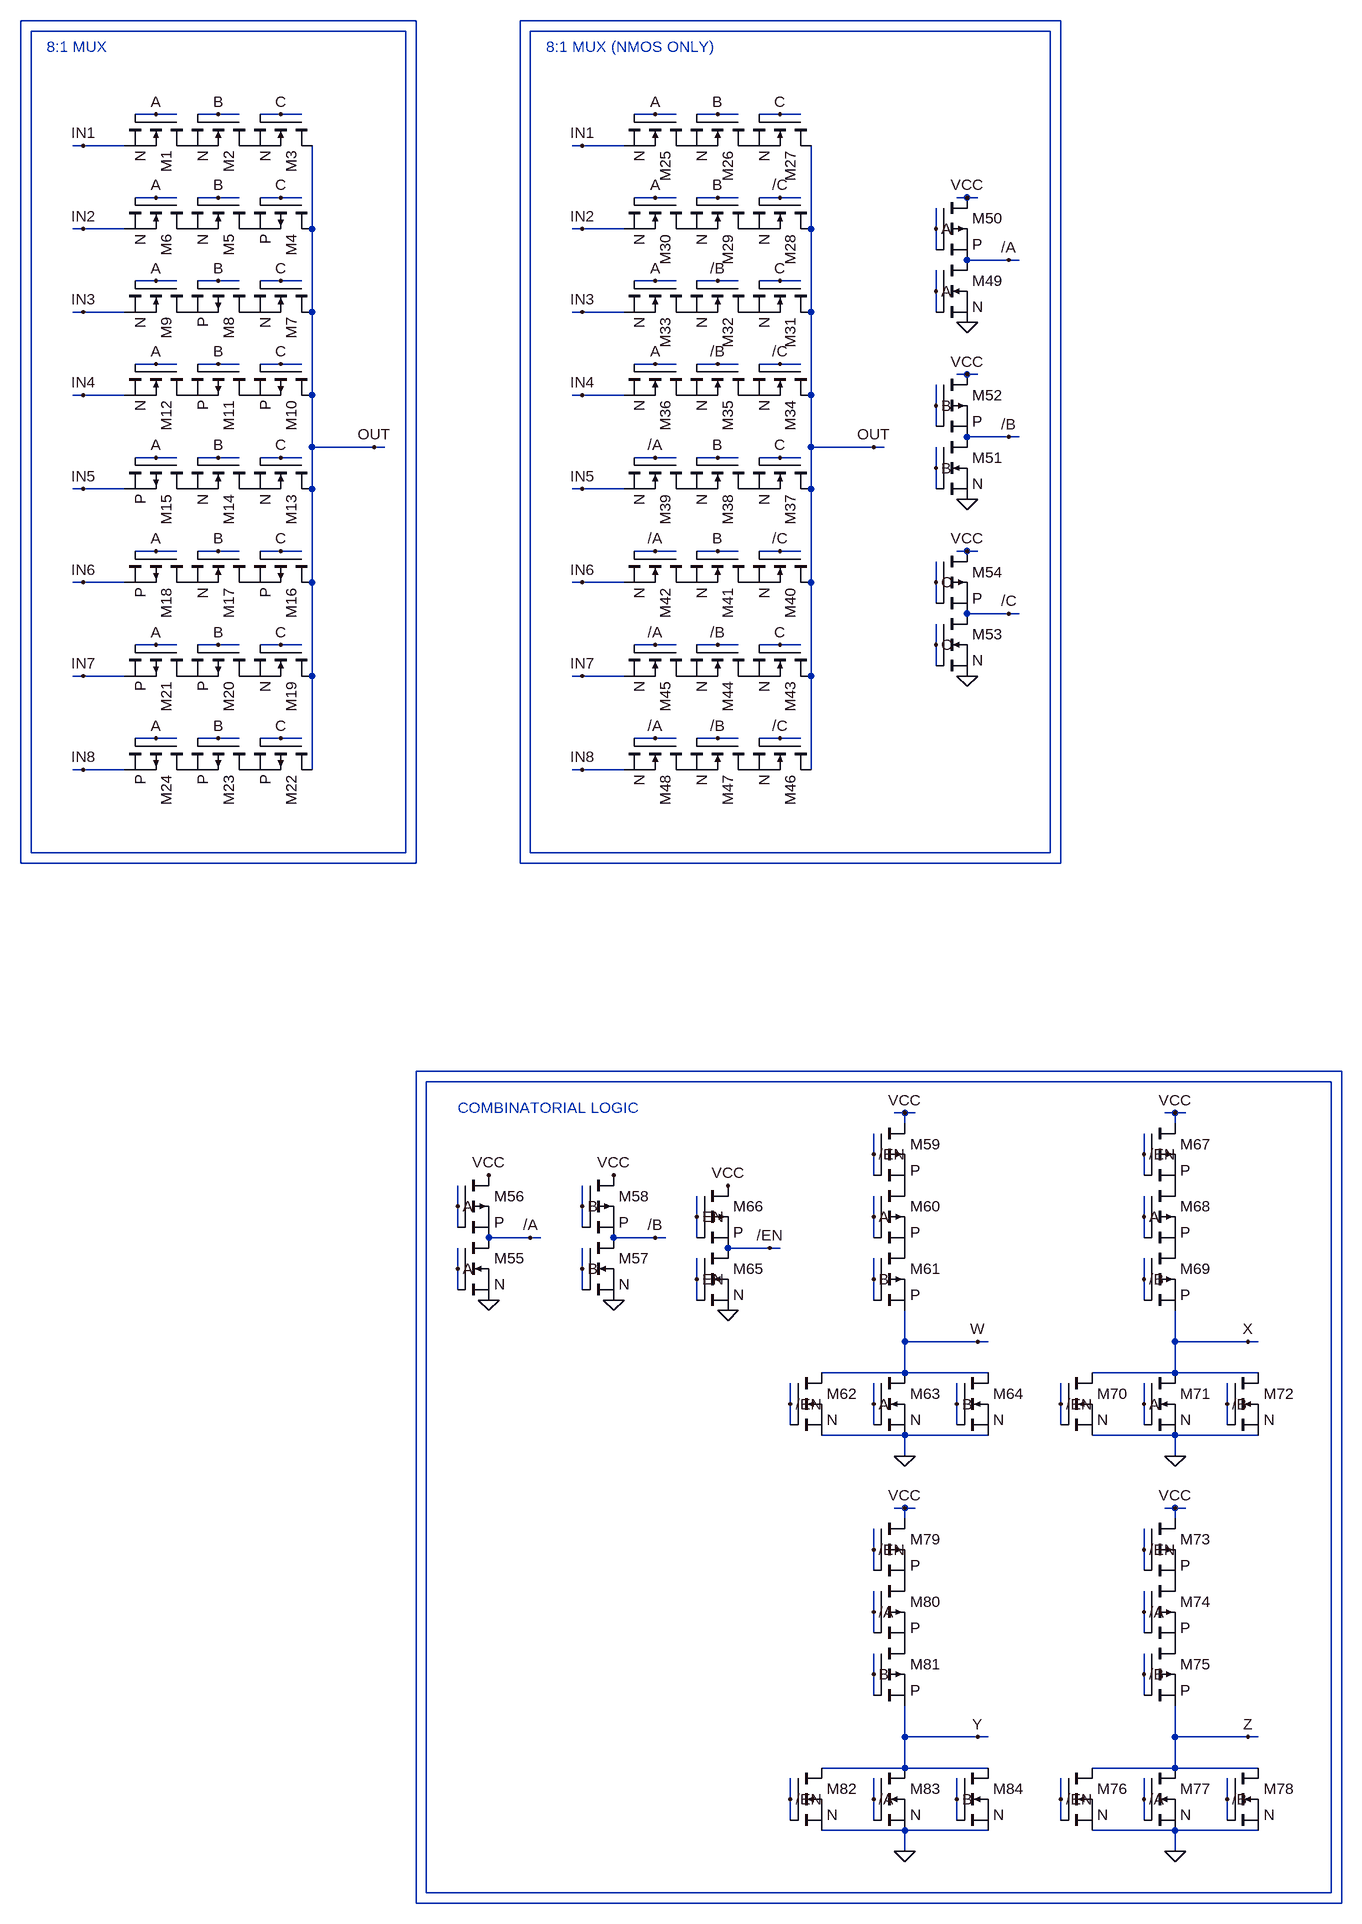
[diagram p0: schematic HW Schematics.asc]
HW Schematics.asc, the LTspice schematic file:
Version 4.1
SHEET 1 2020 2932
WIRE 592 32 -16 32
WIRE 1584 32 752 32
WIRE 576 48 0 48
WIRE 1568 48 768 48
WIRE 192 176 160 176
WIRE 224 176 192 176
WIRE 288 176 256 176
WIRE 320 176 288 176
WIRE 384 176 352 176
WIRE 416 176 384 176
WIRE 960 176 928 176
WIRE 992 176 960 176
WIRE 1056 176 1024 176
WIRE 1088 176 1056 176
WIRE 1152 176 1120 176
WIRE 1184 176 1152 176
WIRE 80 224 64 224
WIRE 144 224 80 224
WIRE 848 224 832 224
WIRE 912 224 848 224
WIRE 192 304 160 304
WIRE 224 304 192 304
WIRE 288 304 256 304
WIRE 320 304 288 304
WIRE 384 304 352 304
WIRE 416 304 384 304
WIRE 960 304 928 304
WIRE 992 304 960 304
WIRE 1056 304 1024 304
WIRE 1088 304 1056 304
WIRE 1152 304 1120 304
WIRE 1184 304 1152 304
WIRE 1440 304 1424 304
WIRE 1456 304 1440 304
WIRE 80 352 64 352
WIRE 144 352 80 352
WIRE 432 352 432 224
WIRE 848 352 832 352
WIRE 912 352 848 352
WIRE 1200 352 1200 224
WIRE 1392 352 1392 320
WIRE 1392 384 1392 352
WIRE 1504 400 1440 400
WIRE 1520 400 1504 400
WIRE 192 432 160 432
WIRE 224 432 192 432
WIRE 288 432 256 432
WIRE 320 432 288 432
WIRE 384 432 352 432
WIRE 416 432 384 432
WIRE 960 432 928 432
WIRE 992 432 960 432
WIRE 1056 432 1024 432
WIRE 1088 432 1056 432
WIRE 1152 432 1120 432
WIRE 1184 432 1152 432
WIRE 1392 448 1392 416
WIRE 80 480 64 480
WIRE 144 480 80 480
WIRE 432 480 432 352
WIRE 848 480 832 480
WIRE 912 480 848 480
WIRE 1200 480 1200 352
WIRE 1392 480 1392 448
WIRE 192 560 160 560
WIRE 224 560 192 560
WIRE 288 560 256 560
WIRE 320 560 288 560
WIRE 384 560 352 560
WIRE 416 560 384 560
WIRE 960 560 928 560
WIRE 992 560 960 560
WIRE 1056 560 1024 560
WIRE 1088 560 1056 560
WIRE 1152 560 1120 560
WIRE 1184 560 1152 560
WIRE 1440 576 1424 576
WIRE 1456 576 1440 576
WIRE 80 608 64 608
WIRE 144 608 80 608
WIRE 432 608 432 480
WIRE 848 608 832 608
WIRE 912 608 848 608
WIRE 1200 608 1200 480
WIRE 1392 624 1392 592
WIRE 1392 656 1392 624
WIRE 1504 672 1440 672
WIRE 1520 672 1504 672
WIRE 432 688 432 608
WIRE 528 688 432 688
WIRE 544 688 528 688
WIRE 1200 688 1200 608
WIRE 1296 688 1200 688
WIRE 1312 688 1296 688
WIRE 192 704 160 704
WIRE 224 704 192 704
WIRE 288 704 256 704
WIRE 320 704 288 704
WIRE 384 704 352 704
WIRE 416 704 384 704
WIRE 960 704 928 704
WIRE 992 704 960 704
WIRE 1056 704 1024 704
WIRE 1088 704 1056 704
WIRE 1152 704 1120 704
WIRE 1184 704 1152 704
WIRE 1392 720 1392 688
WIRE 80 752 64 752
WIRE 144 752 80 752
WIRE 432 752 432 688
WIRE 848 752 832 752
WIRE 912 752 848 752
WIRE 1200 752 1200 688
WIRE 1392 752 1392 720
WIRE 192 848 160 848
WIRE 224 848 192 848
WIRE 288 848 256 848
WIRE 320 848 288 848
WIRE 384 848 352 848
WIRE 416 848 384 848
WIRE 960 848 928 848
WIRE 992 848 960 848
WIRE 1056 848 1024 848
WIRE 1088 848 1056 848
WIRE 1152 848 1120 848
WIRE 1184 848 1152 848
WIRE 1440 848 1424 848
WIRE 1456 848 1440 848
WIRE 80 896 64 896
WIRE 144 896 80 896
WIRE 432 896 432 752
WIRE 848 896 832 896
WIRE 912 896 848 896
WIRE 1200 896 1200 752
WIRE 1392 896 1392 864
WIRE 1392 928 1392 896
WIRE 1504 944 1440 944
WIRE 1520 944 1504 944
WIRE 192 992 160 992
WIRE 224 992 192 992
WIRE 288 992 256 992
WIRE 320 992 288 992
WIRE 384 992 352 992
WIRE 416 992 384 992
WIRE 960 992 928 992
WIRE 992 992 960 992
WIRE 1056 992 1024 992
WIRE 1088 992 1056 992
WIRE 1152 992 1120 992
WIRE 1184 992 1152 992
WIRE 1392 992 1392 960
WIRE 1392 1024 1392 992
WIRE 80 1040 64 1040
WIRE 144 1040 80 1040
WIRE 432 1040 432 896
WIRE 848 1040 832 1040
WIRE 912 1040 848 1040
WIRE 1200 1040 1200 896
WIRE 192 1136 160 1136
WIRE 224 1136 192 1136
WIRE 288 1136 256 1136
WIRE 320 1136 288 1136
WIRE 384 1136 352 1136
WIRE 416 1136 384 1136
WIRE 960 1136 928 1136
WIRE 992 1136 960 1136
WIRE 1056 1136 1024 1136
WIRE 1088 1136 1056 1136
WIRE 1152 1136 1120 1136
WIRE 1184 1136 1152 1136
WIRE 80 1184 64 1184
WIRE 144 1184 80 1184
WIRE 432 1184 432 1040
WIRE 848 1184 832 1184
WIRE 912 1184 848 1184
WIRE 1200 1184 1200 1040
WIRE 0 1312 0 48
WIRE 576 1312 576 48
WIRE 576 1312 0 1312
WIRE 768 1312 768 48
WIRE 1568 1312 1568 48
WIRE 1568 1312 768 1312
WIRE -16 1328 -16 32
WIRE 592 1328 592 32
WIRE 592 1328 -16 1328
WIRE 752 1328 752 32
WIRE 1584 1328 1584 32
WIRE 1584 1328 752 1328
WIRE 2016 1648 592 1648
WIRE 2000 1664 608 1664
WIRE 1344 1712 1328 1712
WIRE 1360 1712 1344 1712
WIRE 1760 1712 1744 1712
WIRE 1776 1712 1760 1712
WIRE 1344 1728 1344 1712
WIRE 1760 1728 1760 1712
WIRE 1296 1776 1296 1744
WIRE 1712 1776 1712 1744
WIRE 1296 1808 1296 1776
WIRE 1712 1808 1712 1776
WIRE 656 1856 656 1824
WIRE 848 1856 848 1824
WIRE 1024 1872 1024 1840
WIRE 1296 1872 1296 1840
WIRE 1712 1872 1712 1840
WIRE 656 1888 656 1856
WIRE 848 1888 848 1856
WIRE 768 1904 704 1904
WIRE 784 1904 768 1904
WIRE 960 1904 896 1904
WIRE 976 1904 960 1904
WIRE 1024 1904 1024 1872
WIRE 1296 1904 1296 1872
WIRE 1712 1904 1712 1872
WIRE 1136 1920 1072 1920
WIRE 1152 1920 1136 1920
WIRE 656 1952 656 1920
WIRE 848 1952 848 1920
WIRE 1024 1968 1024 1936
WIRE 1296 1968 1296 1936
WIRE 1712 1968 1712 1936
WIRE 656 1984 656 1952
WIRE 848 1984 848 1952
WIRE 1024 2000 1024 1968
WIRE 1296 2000 1296 1968
WIRE 1712 2000 1712 1968
WIRE 1344 2064 1344 2016
WIRE 1456 2064 1344 2064
WIRE 1472 2064 1456 2064
WIRE 1760 2064 1760 2016
WIRE 1872 2064 1760 2064
WIRE 1888 2064 1872 2064
WIRE 1344 2112 1344 2064
WIRE 1344 2112 1216 2112
WIRE 1472 2112 1344 2112
WIRE 1760 2112 1760 2064
WIRE 1760 2112 1632 2112
WIRE 1888 2112 1760 2112
WIRE 1168 2160 1168 2128
WIRE 1296 2160 1296 2128
WIRE 1424 2160 1424 2128
WIRE 1584 2160 1584 2128
WIRE 1712 2160 1712 2128
WIRE 1840 2160 1840 2128
WIRE 1168 2192 1168 2160
WIRE 1296 2192 1296 2160
WIRE 1424 2192 1424 2160
WIRE 1584 2192 1584 2160
WIRE 1712 2192 1712 2160
WIRE 1840 2192 1840 2160
WIRE 1344 2208 1216 2208
WIRE 1472 2208 1344 2208
WIRE 1760 2208 1632 2208
WIRE 1888 2208 1760 2208
WIRE 1344 2240 1344 2208
WIRE 1760 2240 1760 2208
WIRE 1344 2320 1328 2320
WIRE 1360 2320 1344 2320
WIRE 1760 2320 1744 2320
WIRE 1776 2320 1760 2320
WIRE 1344 2336 1344 2320
WIRE 1760 2336 1760 2320
WIRE 1296 2384 1296 2352
WIRE 1712 2384 1712 2352
WIRE 1296 2416 1296 2384
WIRE 1712 2416 1712 2384
WIRE 1296 2480 1296 2448
WIRE 1712 2480 1712 2448
WIRE 1296 2512 1296 2480
WIRE 1712 2512 1712 2480
WIRE 1296 2576 1296 2544
WIRE 1712 2576 1712 2544
WIRE 1296 2608 1296 2576
WIRE 1712 2608 1712 2576
WIRE 1344 2672 1344 2624
WIRE 1456 2672 1344 2672
WIRE 1472 2672 1456 2672
WIRE 1760 2672 1760 2624
WIRE 1872 2672 1760 2672
WIRE 1888 2672 1872 2672
WIRE 1344 2720 1344 2672
WIRE 1344 2720 1216 2720
WIRE 1472 2720 1344 2720
WIRE 1760 2720 1760 2672
WIRE 1760 2720 1632 2720
WIRE 1888 2720 1760 2720
WIRE 1168 2768 1168 2736
WIRE 1296 2768 1296 2736
WIRE 1424 2768 1424 2736
WIRE 1584 2768 1584 2736
WIRE 1712 2768 1712 2736
WIRE 1840 2768 1840 2736
WIRE 1168 2800 1168 2768
WIRE 1296 2800 1296 2768
WIRE 1424 2800 1424 2768
WIRE 1584 2800 1584 2768
WIRE 1712 2800 1712 2768
WIRE 1840 2800 1840 2768
WIRE 1344 2816 1216 2816
WIRE 1472 2816 1344 2816
WIRE 1760 2816 1632 2816
WIRE 1888 2816 1760 2816
WIRE 1344 2848 1344 2816
WIRE 1760 2848 1760 2816
WIRE 608 2912 608 1664
WIRE 2000 2912 2000 1664
WIRE 2000 2912 608 2912
WIRE 592 2928 592 1648
WIRE 2016 2928 2016 1648
WIRE 2016 2928 592 2928
FLAG 192 176 A
FLAG 288 176 B
FLAG 384 176 C
FLAG 384 304 C
FLAG 192 304 A
FLAG 288 304 B
FLAG 192 432 A
FLAG 288 432 B
FLAG 384 432 C
FLAG 192 560 A
FLAG 288 560 B
FLAG 384 560 C
FLAG 192 704 A
FLAG 288 704 B
FLAG 384 704 C
FLAG 192 848 A
FLAG 288 848 B
FLAG 384 848 C
FLAG 192 992 A
FLAG 288 992 B
FLAG 384 992 C
FLAG 192 1136 A
FLAG 288 1136 B
FLAG 384 1136 C
FLAG 528 688 OUT
FLAG 80 224 IN1
FLAG 80 352 IN2
FLAG 80 480 IN3
FLAG 80 608 IN4
FLAG 80 752 IN5
FLAG 80 896 IN6
FLAG 80 1040 IN7
FLAG 80 1184 IN8
FLAG 960 176 A
FLAG 1056 176 B
FLAG 1152 176 C
FLAG 1152 304 /C
FLAG 960 304 A
FLAG 1056 304 B
FLAG 960 432 A
FLAG 1056 432 /B
FLAG 1152 432 C
FLAG 960 560 A
FLAG 1056 560 /B
FLAG 1152 560 /C
FLAG 960 704 /A
FLAG 1056 704 B
FLAG 1152 704 C
FLAG 960 848 /A
FLAG 1056 848 B
FLAG 1152 848 /C
FLAG 960 992 /A
FLAG 1056 992 /B
FLAG 1152 992 C
FLAG 960 1136 /A
FLAG 1056 1136 /B
FLAG 1152 1136 /C
FLAG 1296 688 OUT
FLAG 848 224 IN1
FLAG 848 352 IN2
FLAG 848 480 IN3
FLAG 848 608 IN4
FLAG 848 752 IN5
FLAG 848 896 IN6
FLAG 848 1040 IN7
FLAG 848 1184 IN8
FLAG 1440 304 VCC
FLAG 1440 496 0
FLAG 1392 352 A
FLAG 1392 448 A
FLAG 1504 400 /A
FLAG 1440 576 VCC
FLAG 1440 768 0
FLAG 1392 624 B
FLAG 1392 720 B
FLAG 1504 672 /B
FLAG 1440 848 VCC
FLAG 1440 1040 0
FLAG 1392 896 C
FLAG 1392 992 C
FLAG 1504 944 /C
FLAG 704 1808 VCC
FLAG 704 2000 0
FLAG 656 1856 A
FLAG 656 1952 A
FLAG 768 1904 /A
FLAG 896 1808 VCC
FLAG 896 2000 0
FLAG 848 1856 B
FLAG 848 1952 B
FLAG 960 1904 /B
FLAG 1344 1712 VCC
FLAG 1344 2240 0
FLAG 1072 1824 VCC
FLAG 1072 2016 0
FLAG 1024 1872 EN
FLAG 1024 1968 EN
FLAG 1136 1920 /EN
FLAG 1296 1776 /EN
FLAG 1168 2160 /EN
FLAG 1760 1712 VCC
FLAG 1760 2240 0
FLAG 1712 1776 /EN
FLAG 1584 2160 /EN
FLAG 1760 2320 VCC
FLAG 1760 2848 0
FLAG 1712 2384 /EN
FLAG 1584 2768 /EN
FLAG 1344 2320 VCC
FLAG 1344 2848 0
FLAG 1296 2384 /EN
FLAG 1168 2768 /EN
FLAG 1296 1872 A
FLAG 1296 2160 A
FLAG 1712 1872 A
FLAG 1712 2160 A
FLAG 1456 2064 W
FLAG 1872 2064 X
FLAG 1456 2672 Y
FLAG 1872 2672 Z
FLAG 1296 2480 /A
FLAG 1712 2480 /A
FLAG 1296 2768 /A
FLAG 1712 2768 /A
FLAG 1296 1968 B
FLAG 1424 2160 B
FLAG 1296 2576 B
FLAG 1424 2768 B
FLAG 1712 1968 /B
FLAG 1840 2160 /B
FLAG 1712 2576 /B
FLAG 1840 2768 /B
SYMBOL nmos 240 176 R90
SYMATTR InstName M1
SYMATTR Value N
SYMBOL nmos 336 176 R90
SYMATTR InstName M2
SYMATTR Value N
SYMBOL nmos 432 176 R90
SYMATTR InstName M3
SYMATTR Value N
SYMBOL pmos 432 304 R90
SYMATTR InstName M4
SYMATTR Value P
SYMBOL nmos 336 304 R90
SYMATTR InstName M5
SYMATTR Value N
SYMBOL nmos 240 304 R90
SYMATTR InstName M6
SYMATTR Value N
SYMBOL nmos 432 432 R90
SYMATTR InstName M7
SYMATTR Value N
SYMBOL pmos 336 432 R90
SYMATTR InstName M8
SYMATTR Value P
SYMBOL nmos 240 432 R90
SYMATTR InstName M9
SYMATTR Value N
SYMBOL pmos 432 560 R90
SYMATTR InstName M10
SYMATTR Value P
SYMBOL pmos 336 560 R90
SYMATTR InstName M11
SYMATTR Value P
SYMBOL nmos 240 560 R90
SYMATTR InstName M12
SYMATTR Value N
SYMBOL nmos 432 704 R90
SYMATTR InstName M13
SYMATTR Value N
SYMBOL nmos 336 704 R90
SYMATTR InstName M14
SYMATTR Value N
SYMBOL pmos 240 704 R90
SYMATTR InstName M15
SYMATTR Value P
SYMBOL pmos 432 848 R90
SYMATTR InstName M16
SYMATTR Value P
SYMBOL nmos 336 848 R90
SYMATTR InstName M17
SYMATTR Value N
SYMBOL pmos 240 848 R90
SYMATTR InstName M18
SYMATTR Value P
SYMBOL nmos 432 992 R90
SYMATTR InstName M19
SYMATTR Value N
SYMBOL pmos 336 992 R90
SYMATTR InstName M20
SYMATTR Value P
SYMBOL pmos 240 992 R90
SYMATTR InstName M21
SYMATTR Value P
SYMBOL pmos 432 1136 R90
SYMATTR InstName M22
SYMATTR Value P
SYMBOL pmos 336 1136 R90
SYMATTR InstName M23
SYMATTR Value P
SYMBOL pmos 240 1136 R90
SYMATTR InstName M24
SYMATTR Value P
SYMBOL nmos 1008 176 R90
SYMATTR InstName M25
SYMATTR Value N
SYMBOL nmos 1104 176 R90
SYMATTR InstName M26
SYMATTR Value N
SYMBOL nmos 1200 176 R90
SYMATTR InstName M27
SYMATTR Value N
SYMBOL nmos 1104 304 R90
SYMATTR InstName M29
SYMATTR Value N
SYMBOL nmos 1008 304 R90
SYMATTR InstName M30
SYMATTR Value N
SYMBOL nmos 1200 432 R90
SYMATTR InstName M31
SYMATTR Value N
SYMBOL nmos 1008 432 R90
SYMATTR InstName M33
SYMATTR Value N
SYMBOL nmos 1008 560 R90
SYMATTR InstName M36
SYMATTR Value N
SYMBOL nmos 1200 704 R90
SYMATTR InstName M37
SYMATTR Value N
SYMBOL nmos 1104 704 R90
SYMATTR InstName M38
SYMATTR Value N
SYMBOL nmos 1104 848 R90
SYMATTR InstName M41
SYMATTR Value N
SYMBOL nmos 1200 992 R90
SYMATTR InstName M43
SYMATTR Value N
SYMBOL nmos 1200 304 R90
SYMATTR InstName M28
SYMATTR Value N
SYMBOL nmos 1104 432 R90
SYMATTR InstName M32
SYMATTR Value N
SYMBOL nmos 1200 560 R90
SYMATTR InstName M34
SYMATTR Value N
SYMBOL nmos 1104 560 R90
SYMATTR InstName M35
SYMATTR Value N
SYMBOL nmos 1008 704 R90
SYMATTR InstName M39
SYMATTR Value N
SYMBOL nmos 1200 848 R90
SYMATTR InstName M40
SYMATTR Value N
SYMBOL nmos 1008 848 R90
SYMATTR InstName M42
SYMATTR Value N
SYMBOL nmos 1104 992 R90
SYMATTR InstName M44
SYMATTR Value N
SYMBOL nmos 1008 992 R90
SYMATTR InstName M45
SYMATTR Value N
SYMBOL nmos 1200 1136 R90
SYMATTR InstName M46
SYMATTR Value N
SYMBOL nmos 1104 1136 R90
SYMATTR InstName M47
SYMATTR Value N
SYMBOL nmos 1008 1136 R90
SYMATTR InstName M48
SYMATTR Value N
SYMBOL nmos 1392 400 R0
SYMATTR InstName M49
SYMATTR Value N
SYMBOL pmos 1392 304 R0
SYMATTR InstName M50
SYMATTR Value P
SYMBOL nmos 1392 672 R0
SYMATTR InstName M51
SYMATTR Value N
SYMBOL pmos 1392 576 R0
SYMATTR InstName M52
SYMATTR Value P
SYMBOL nmos 1392 944 R0
SYMATTR InstName M53
SYMATTR Value N
SYMBOL pmos 1392 848 R0
SYMATTR InstName M54
SYMATTR Value P
SYMBOL nmos 656 1904 R0
SYMATTR InstName M55
SYMATTR Value N
SYMBOL pmos 656 1808 R0
SYMATTR InstName M56
SYMATTR Value P
SYMBOL nmos 848 1904 R0
SYMATTR InstName M57
SYMATTR Value N
SYMBOL pmos 848 1808 R0
SYMATTR InstName M58
SYMATTR Value P
SYMBOL pmos 1296 1728 R0
SYMATTR InstName M59
SYMATTR Value P
SYMBOL pmos 1296 1824 R0
SYMATTR InstName M60
SYMATTR Value P
SYMBOL pmos 1296 1920 R0
SYMATTR InstName M61
SYMATTR Value P
SYMBOL nmos 1024 1920 R0
SYMATTR InstName M65
SYMATTR Value N
SYMBOL pmos 1024 1824 R0
SYMATTR InstName M66
SYMATTR Value P
SYMBOL pmos 1712 1728 R0
SYMATTR InstName M67
SYMATTR Value P
SYMBOL pmos 1712 1824 R0
SYMATTR InstName M68
SYMATTR Value P
SYMBOL pmos 1712 1920 R0
SYMATTR InstName M69
SYMATTR Value P
SYMBOL pmos 1712 2336 R0
SYMATTR InstName M73
SYMATTR Value P
SYMBOL pmos 1712 2432 R0
SYMATTR InstName M74
SYMATTR Value P
SYMBOL pmos 1712 2528 R0
SYMATTR InstName M75
SYMATTR Value P
SYMBOL pmos 1296 2336 R0
SYMATTR InstName M79
SYMATTR Value P
SYMBOL pmos 1296 2432 R0
SYMATTR InstName M80
SYMATTR Value P
SYMBOL pmos 1296 2528 R0
SYMATTR InstName M81
SYMATTR Value P
SYMBOL nmos 1168 2112 R0
SYMATTR InstName M62
SYMATTR Value N
SYMBOL nmos 1296 2112 R0
SYMATTR InstName M63
SYMATTR Value N
SYMBOL nmos 1424 2112 R0
SYMATTR InstName M64
SYMATTR Value N
SYMBOL nmos 1584 2112 R0
SYMATTR InstName M70
SYMATTR Value N
SYMBOL nmos 1712 2112 R0
SYMATTR InstName M71
SYMATTR Value N
SYMBOL nmos 1840 2112 R0
SYMATTR InstName M72
SYMATTR Value N
SYMBOL nmos 1584 2720 R0
SYMATTR InstName M76
SYMATTR Value N
SYMBOL nmos 1712 2720 R0
SYMATTR InstName M77
SYMATTR Value N
SYMBOL nmos 1840 2720 R0
SYMATTR InstName M78
SYMATTR Value N
SYMBOL nmos 1168 2720 R0
SYMATTR InstName M82
SYMATTR Value N
SYMBOL nmos 1296 2720 R0
SYMATTR InstName M83
SYMATTR Value N
SYMBOL nmos 1424 2720 R0
SYMATTR InstName M84
SYMATTR Value N
TEXT 24 72 Left 2 ;8:1 MUX
TEXT 792 72 Left 2 ;8:1 MUX (NMOS ONLY)
TEXT 656 1704 Left 2 ;COMBINATORIAL LOGIC

The netlist it stands for:
* HW Schematics.asc
M1 P001 A IN1 IN1 N
M2 P002 B P001 P001 N
M3 OUT C P002 P002 N
M4 OUT C P003 P003 P
M5 P003 B P004 P004 N
M6 P004 A IN2 IN2 N
M7 OUT C P005 P005 N
M8 P005 B P006 P006 P
M9 P006 A IN3 IN3 N
M10 OUT C P007 P007 P
M11 P007 B P008 P008 P
M12 P008 A IN4 IN4 N
M13 OUT C P009 P009 N
M14 P009 B P010 P010 N
M15 P010 A IN5 IN5 P
M16 OUT C P011 P011 P
M17 P011 B P012 P012 N
M18 P012 A IN6 IN6 P
M19 OUT C P013 P013 N
M20 P013 B P014 P014 P
M21 P014 A IN7 IN7 P
M22 OUT C P015 P015 P
M23 P015 B P016 P016 P
M24 P016 A IN8 IN8 P
M25 P017 A IN1 IN1 N
M26 P018 B P017 P017 N
M27 OUT C P018 P018 N
M29 P019 B P020 P020 N
M30 P020 A IN2 IN2 N
M31 OUT C P021 P021 N
M33 P022 A IN3 IN3 N
M36 P023 A IN4 IN4 N
M37 OUT C P024 P024 N
M38 P024 B P025 P025 N
M41 P026 B P027 P027 N
M43 OUT C P028 P028 N
M28 OUT /C P019 P019 N
M32 P021 /B P022 P022 N
M34 OUT /C P029 P029 N
M35 P029 /B P023 P023 N
M39 P025 /A IN5 IN5 N
M40 OUT /C P026 P026 N
M42 P027 /A IN6 IN6 N
M44 P028 /B P030 P030 N
M45 P030 /A IN7 IN7 N
M46 OUT /C P031 P031 N
M47 P031 /B P032 P032 N
M48 P032 /A IN8 IN8 N
M49 /A A 0 0 N
M50 VCC A /A /A P
M51 /B B 0 0 N
M52 VCC B /B /B P
M53 /C C 0 0 N
M54 VCC C /C /C P
M55 /A A 0 0 N
M56 VCC A /A /A P
M57 /B B 0 0 N
M58 VCC B /B /B P
M59 VCC /EN P033 P033 P
M60 P033 A P034 P034 P
M61 P034 B W W P
M65 /EN EN 0 0 N
M66 VCC EN /EN /EN P
M67 VCC /EN P035 P035 P
M68 P035 A P036 P036 P
M69 P036 /B X X P
M73 VCC /EN P037 P037 P
M74 P037 /A P038 P038 P
M75 P038 /B Z Z P
M79 VCC /EN P039 P039 P
M80 P039 /A P040 P040 P
M81 P040 B Y Y P
M62 W /EN 0 0 N
M63 W A 0 0 N
M64 W B 0 0 N
M70 X /EN 0 0 N
M71 X A 0 0 N
M72 X /B 0 0 N
M76 Z /EN 0 0 N
M77 Z /A 0 0 N
M78 Z /B 0 0 N
M82 Y /EN 0 0 N
M83 Y /A 0 0 N
M84 Y B 0 0 N
.model NMOS NMOS
.model PMOS PMOS
.lib standard.mos
* 8:1 MUX
* 8:1 MUX (NMOS ONLY)
* COMBINATORIAL LOGIC
.backanno
.end